# Altium schematic sheet CAN-Sheet.SchDoc
size 420 x 297 mm; SheetNumber: 8; SheetTotal: 15
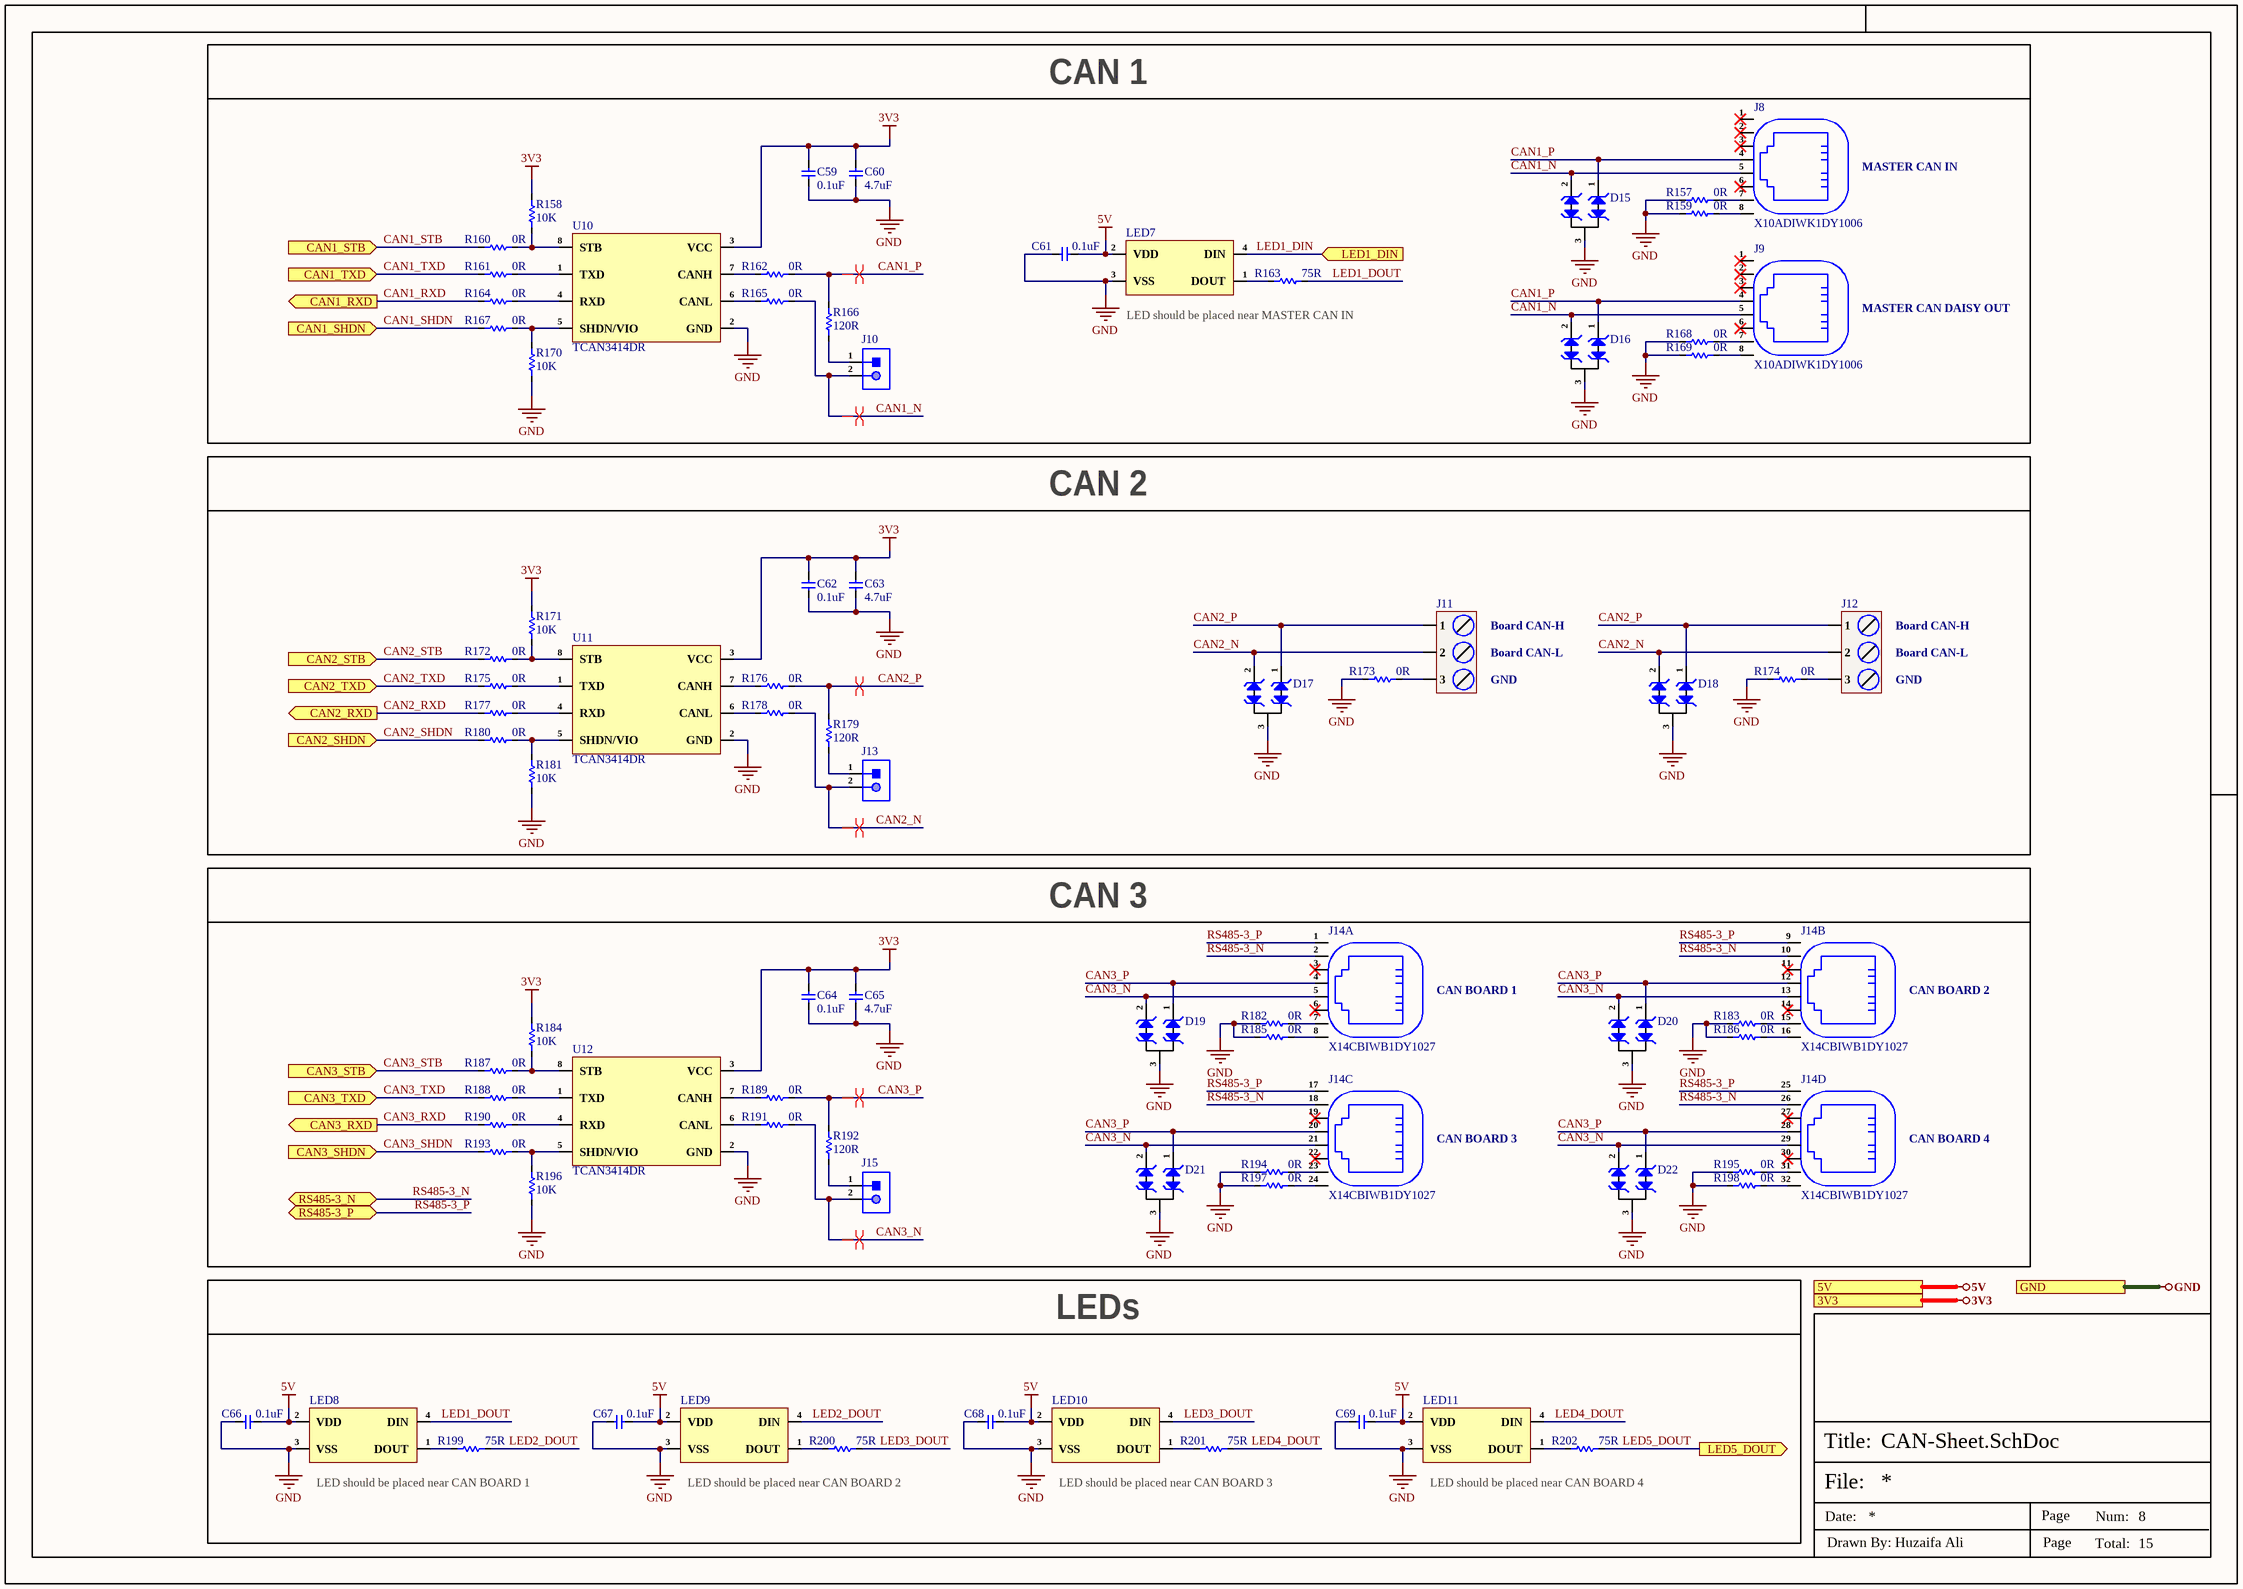
[diagram p0: CAN-Sheet.SchDoc]

## Parts
C59  0.1uF  [Cap-0402]
C60  4.7uF  [Cap-0402]
C61  0.1uF  [Cap-0402]
C62  0.1uF  [Cap-0402]
C63  4.7uF  [Cap-0402]
C64  0.1uF  [Cap-0402]
C65  4.7uF  [Cap-0402]
C66  0.1uF  [Cap-0402]
C67  0.1uF  [Cap-0402]
C68  0.1uF  [Cap-0402]
C69  0.1uF  [Cap-0402]
D15  CDSOT23-T24CAN-Q  [SOT-23]  (value not drawn)
D16  CDSOT23-T24CAN-Q  [SOT-23]  (value not drawn)
D17  CDSOT23-T24CAN-Q  [SOT-23]  (value not drawn)
D18  CDSOT23-T24CAN-Q  [SOT-23]  (value not drawn)
D19  CDSOT23-T24CAN-Q  [SOT-23]  (value not drawn)
D20  CDSOT23-T24CAN-Q  [SOT-23]  (value not drawn)
D21  CDSOT23-T24CAN-Q  [SOT-23]  (value not drawn)
D22  CDSOT23-T24CAN-Q  [SOT-23]  (value not drawn)
J8  X10ADIWK1DY1006  [X10ADIWK1DY1006]
J9  X10ADIWK1DY1006  [X10ADIWK1DY1006]
J10  X6511WV-02H-C60D30  [HDR1X2_]  (value not drawn)
J11  DB128L-5.08-3P-BK-S  [DB128L-5.08-3P-BK-S]  (value not drawn)
J12  DB128L-5.08-3P-BK-S  [DB128L-5.08-3P-BK-S]  (value not drawn)
J13  X6511WV-02H-C60D30  [HDR1X2_]  (value not drawn)
J14  X14CBIWB1DY1027  [X14CBIWB1DY1027]  (parts A,B,C,D of 4)
J15  X6511WV-02H-C60D30  [HDR1X2_]  (value not drawn)
LED7  WS2812D-F5  [WS2812D-F5]  (value not drawn)
LED8  WS2812D-F5  [WS2812D-F5]  (value not drawn)
LED9  WS2812D-F5  [WS2812D-F5]  (value not drawn)
LED10  WS2812D-F5  [WS2812D-F5]  (value not drawn)
LED11  WS2812D-F5  [WS2812D-F5]  (value not drawn)
R157  0R  [Res-0402]
R158  10K  [Res-0402]
R159  0R  [Res-0402]
R160  0R  [Res-0402]
R161  0R  [Res-0402]
R162  0R  [Res-0402]
R163  75R  [Res-0402]
R164  0R  [Res-0402]
R165  0R  [Res-0402]
R166  120R  [Res-0603]
R167  0R  [Res-0402]
R168  0R  [Res-0402]
R169  0R  [Res-0402]
R170  10K  [Res-0402]
R171  10K  [Res-0402]
R172  0R  [Res-0402]
R173  0R  [Res-0402]
R174  0R  [Res-0402]
R175  0R  [Res-0402]
R176  0R  [Res-0402]
R177  0R  [Res-0402]
R178  0R  [Res-0402]
R179  120R  [Res-0603]
R180  0R  [Res-0402]
R181  10K  [Res-0402]
R182  0R  [Res-0402]
R183  0R  [Res-0402]
R184  10K  [Res-0402]
R185  0R  [Res-0402]
R186  0R  [Res-0402]
R187  0R  [Res-0402]
R188  0R  [Res-0402]
R189  0R  [Res-0402]
R190  0R  [Res-0402]
R191  0R  [Res-0402]
R192  120R  [Res-0603]
R193  0R  [Res-0402]
R194  0R  [Res-0402]
R195  0R  [Res-0402]
R196  10K  [Res-0402]
R197  0R  [Res-0402]
R198  0R  [Res-0402]
R199  75R  [Res-0402]
R200  75R  [Res-0402]
R201  75R  [Res-0402]
R202  75R  [Res-0402]
U10  TCAN3414DR  [SOIC-8(0.154", 3.90mm Width)]
U11  TCAN3414DR  [SOIC-8(0.154", 3.90mm Width)]
U12  TCAN3414DR  [SOIC-8(0.154", 3.90mm Width)]

## Blocks framed on the sheet
CAN 1: C59-C61 D15 D16 J8-J10 LED7 R157-R170 U10
CAN 2: C62 C63 D17 D18 J11-J13 R171-R181 U11
CAN 3: C64 C65 D19-D22 J14 J15 R182-R198 U12
LEDs: C66-C69 LED8-LED11 R199-R202

## Ports
3V3 (see Top-Sheet[2B], Buttons-Lights-Sensors-Sheet[4D], Controller-Sheet-1[4D], Controller-Sheet-2[4D], EtherCAT-Sheet[1D], Ethernet-PHY-Sheet[4D], Power-Sheet[4D], RS232-Sheet[5D], RS485-Sheet[5D], USB-Sheet[4D], VFD-Support-Sheet[4D]), 5V (see Top-Sheet[2B], Buttons-Lights-Sensors-Sheet[4D], Controller-Sheet-2[4D], Power-Sheet[4D], RS232-Sheet[5D], RS485-Sheet[5D], USB-Sheet[4D], VFD-Support-Sheet[4D]), CAN1_RXD (out, see Top-Sheet[2C]), CAN1_SHDN (in, see Top-Sheet[2B]), CAN1_STB (in, see Top-Sheet[2B]), CAN1_TXD (in, see Top-Sheet[2B]), CAN2_RXD (out, see Top-Sheet[2C]), CAN2_SHDN (in, see Top-Sheet[2C]), CAN2_STB (in, see Top-Sheet[2C]), CAN2_TXD (in, see Top-Sheet[2B]), CAN3_RXD (out, see Top-Sheet[2C]), CAN3_SHDN (in, see Top-Sheet[2C]), CAN3_STB (in, see Top-Sheet[2C]), CAN3_TXD (in, see Top-Sheet[2C]), GND (see Top-Sheet[2B], Buttons-Lights-Sensors-Sheet[4D], Controller-Sheet-1[4D], Controller-Sheet-2[4D], Controller-Sheet-3[4D], EtherCAT-Sheet[1D], Ethernet-PHY-Sheet[4D], Extra-DIOs[4D], Power-Sheet[4D], RS232-Sheet[5D], RS485-Sheet[5D], USB-Sheet[4D], VFD-Support-Sheet2[4D], VFD-Support-Sheet[4D]), LED1_DIN (in, see Top-Sheet[2C]), LED5_DOUT (out, see Top-Sheet[2C], RS232-Sheet[5B]), RS485-3_N (bidir, see Top-Sheet[2C], RS485-Sheet[3D]), RS485-3_P (bidir, see Top-Sheet[2C], RS485-Sheet[3D])

## Nets
3V3: C59.2 C60.2 C62.2 C63.2 C64.2 C65.2 R158.2 R171.2 R184.2 U10.3(VCC) U11.3(VCC) U12.3(VCC) ; port 3V3
5V: C61.2 C66.2 C67.2 C68.2 C69.2 LED7.2(VDD) LED8.2(VDD) LED9.2(VDD) LED10.2(VDD) LED11.2(VDD) ; port 5V
GND: C59.1 C60.1 C61.1 C62.1 C63.1 C64.1 C65.1 C66.1 C67.1 C68.1 C69.1 D15.3 D16.3 D17.3 D18.3 D19.3 D20.3 D21.3 D22.3 LED7.3(VSS) LED8.3(VSS) LED9.3(VSS) LED10.3(VSS) LED11.3(VSS) R157.1 R159.1 R168.1 R169.1 R170.1 R173.1 R174.1 R181.1 R182.1 R183.1 R185.1 R186.1 R194.1 R195.1 R196.1 R197.1 R198.1 U10.2(GND) U11.2(GND) U12.2(GND) ; port GND
CAN1_N: D15.2 D16.2 J8.5 J9.5 J10.2 R165.2
CAN1_P: D15.1 D16.1 J8.4 J9.4 R162.2 R166.2
CAN1_RXD: R164.1 ; port CAN1_RXD
CAN1_SHDN: R167.1 ; port CAN1_SHDN
CAN1_STB: R160.1 ; port CAN1_STB
CAN1_TXD: R161.1 ; port CAN1_TXD
CAN2_N: D17.2 D18.2 J11.2 J12.2 J13.2 R178.2
CAN2_P: D17.1 D18.1 J11.1 J12.1 R176.2 R179.2
CAN2_RXD: R177.1 ; port CAN2_RXD
CAN2_SHDN: R180.1 ; port CAN2_SHDN
CAN2_STB: R172.1 ; port CAN2_STB
CAN2_TXD: R175.1 ; port CAN2_TXD
CAN3_N: D19.2 D20.2 D21.2 D22.2 J14.5 J14.13 J14.21 J14.29 J15.2 R191.2
CAN3_P: D19.1 D20.1 D21.1 D22.1 J14.4 J14.12 J14.20 J14.28 R189.2 R192.2
CAN3_RXD: R190.1 ; port CAN3_RXD
CAN3_SHDN: R193.1 ; port CAN3_SHDN
CAN3_STB: R187.1 ; port CAN3_STB
CAN3_TXD: R188.1 ; port CAN3_TXD
LED1_DIN: LED7.4(DIN) ; port LED1_DIN
LED1_DOUT: LED8.4(DIN) R163.2
LED2_DOUT: LED9.4(DIN) R199.2
LED3_DOUT: LED10.4(DIN) R200.2
LED4_DOUT: LED11.4(DIN) R201.2
LED5_DOUT: R202.2 ; port LED5_DOUT
RS485-3_N: J14.2 J14.10 J14.18 J14.26 ; port RS485-3_N
RS485-3_P: J14.1 J14.9 J14.17 J14.25 ; port RS485-3_P
NetJ8_7: J8.7 R157.2
NetJ8_8: J8.8 R159.2
NetJ9_7: J9.7 R168.2
NetJ9_8: J9.8 R169.2
NetJ10_1: J10.1 R166.1
NetJ11_3: J11.3 R173.2
NetJ12_3: J12.3 R174.2
NetJ13_1: J13.1 R179.1
NetJ14_7: J14.7 R182.2
NetJ14_8: J14.8 R185.2
NetJ14_15: J14.15 R183.2
NetJ14_16: J14.16 R186.2
NetJ14_23: J14.23 R194.2
NetJ14_24: J14.24 R197.2
NetJ14_31: J14.31 R195.2
NetJ14_32: J14.32 R198.2
NetJ15_1: J15.1 R192.1
NetLED7_1: LED7.1(DOUT) R163.1
NetLED8_1: LED8.1(DOUT) R199.1
NetLED9_1: LED9.1(DOUT) R200.1
NetLED10_1: LED10.1(DOUT) R201.1
NetLED11_1: LED11.1(DOUT) R202.1
NetR158_1: R158.1 R160.2 U10.8(STB)
NetR161_2: R161.2 U10.1(TXD)
NetR162_1: R162.1 U10.7(CANH)
NetR164_2: R164.2 U10.4(RXD)
NetR165_1: R165.1 U10.6(CANL)
NetR167_2: R167.2 R170.2 U10.5(SHDN/VIO)
NetR171_1: R171.1 R172.2 U11.8(STB)
NetR175_2: R175.2 U11.1(TXD)
NetR176_1: R176.1 U11.7(CANH)
NetR177_2: R177.2 U11.4(RXD)
NetR178_1: R178.1 U11.6(CANL)
NetR180_2: R180.2 R181.2 U11.5(SHDN/VIO)
NetR184_1: R184.1 R187.2 U12.8(STB)
NetR188_2: R188.2 U12.1(TXD)
NetR189_1: R189.1 U12.7(CANH)
NetR190_2: R190.2 U12.4(RXD)
NetR191_1: R191.1 U12.6(CANL)
NetR193_2: R193.2 R196.2 U12.5(SHDN/VIO)

Not connected (* = marked no-connect by the designer): J8 1* 2* 3* 6*; J9 1* 2* 3* 6*; J14 3* 6* 11* 14* 19* 22* 27* 30*

## Layout directives
differential pair; differential pair class CAN: CAN1_N, CAN1_P, CAN2_N, CAN2_P, CAN3_N, CAN3_P

## Notes on the sheet
- MASTER CAN IN
- LED should be placed near MASTER CAN IN
- MASTER CAN DAISY OUT
- Board CAN-H
- Board CAN-L
- GND
- CAN BOARD 1
- CAN BOARD 2
- CAN BOARD 3
- CAN BOARD 4
- LED should be placed near CAN BOARD 1
- LED should be placed near CAN BOARD 2
- LED should be placed near CAN BOARD 3
- LED should be placed near CAN BOARD 4
- File:
- Title:
- Date:
- Page
- Num:
- Total:
- Drawn By: Huzaifa Ali

## Library data of the parts
C59 C61 C62 C64 C66-C69 = CC0402JRX7R7BB104: CAP CER 0.1UF 16V X7R 0402; Manufacturer: Yageo; Material: 4241ConductorMaterial; Value: 100nF; Tolerance: 5%; Item Type: Capacitor; Supplier: Digikey; Supplier Part Number: 311-1676-1-ND; Manufacturer Part Number: CC0402JRX7R7BB104; RoHS: Yes; Category: Ceramic Capacitors; Stock: 1659111; Pricing: 1=0.1, 10=0.046, 50=0.0262, 100=0.0203, 500=0.01528, 1000=0.012, 2500=0.01091, 5000=0.01004 (USD); Mounting Technology: Surface Mount; Case/Package: 0402; Case Code (Metric): 1005; Case Code (Imperial): 0402; Min Operating Temperature: -55°C; Max Operating Temperature: 125°C; Dielectric: X7R; Packaging: Tape and Reel; Package Quantity: 10000; Voltage Rating (DC): 16V; Voltage Rating: 16V; Series: CC; Construction: Flat; Length: 0.039inch; Width: 0.02inch; Height: 0.5mm; Thickness: 0.022inch; Lead Free: Lead Free; Halogen Free: Halogen Free; RoHS Compliant: Yes; ComponentLink1URL: https://datasheet.ciiva.com/13210/upy-gphc-x7r-6-3v-to-50v-8-12304-13210152.pdf?src-supplier=Mouser; ComponentLink1Description: https://datasheet.ciiva.com/13210/upy-gphc-x7r-6-3v-to-50v-8-12304-13210152.pdf?src-supplier=Mouser; LCSC Part Number: C541464
C60 C63 C65 = CC0402KRX5R6BB475: CAP CER 4.7UF 10V X5R 0402; Manufacturer: Yageo; Tolerance: 10%; Supplier 1: Farnell; Manufacturer Part Number: CC0402KRX5R6BB475; RoHS: Yes; Category: Ceramic Capacitors; Stock 1: 20000; Pricing 1: 10000=0.02310, 50000=0.02100 (GBP); Mount: Surface Mount; Case/Package: 0402; Case Code (Imperial): 0402; Case Code (Metric): 1005; Min Operating Temperature: -55°C; Max Operating Temperature: 85°C; Packaging: Cut Tape; Capacitance: 4.7uF; Voltage Rating: 10V; RoHS Compliant: Yes; ComponentLink1URL: http://www.yageo.com/documents/recent/UPY-GPHC_X5R_4V-to-50V_25.pdf?src-supplier=Digi-Key; ComponentLink1Description: http://www.yageo.com/documents/recent/UPY-GPHC_X5R_4V-to-50V_25.pdf?src-supplier=Digi-Key; Supplier Part Number 1: 3871698; LCSC Part Number: C326586
D15-D22 = CDSOT23-T24CAN-Q: TVS DIODE 24VWM 40VC SOT23-3; Manufacturer: Bourns; Item Type: TVS Diodes; Supplier: Digikey; LCSC Part Number: C350941; Manufacturer Part Number: CDSOT23-T24CAN-Q; RoHS: Yes; Stock: 17231; Pricing: 1=0.36, 10=0.282, 100=0.1691, 500=0.15656, 1000=0.10645, 3000=0.098, 6000=0.09393, 9000=0.08454, 30000=0.08328, 75000=0.07827 (USD); RoHS Compliant: 5897YesNo; ComponentLink1URL: http://www.farnell.com/datasheets/2372435.pdf?src-supplier=Farnell; ComponentLink1Description: http://www.farnell.com/datasheets/2372435.pdf?src-supplier=Farnell; ComponentLink2URL: https://www.bourns.com/docs/Product-Datasheets/cdsot23-t24can-Q.pdf?src-supplier=Digikey; ComponentLink2Description: https://www.bourns.com/docs/Product-Datasheets/cdsot23-t24can-Q.pdf?src-supplier=Digikey; ComponentLink3URL: http://www.farnell.com/datasheets/2372435.pdf?src-supplier=Newark; ComponentLink3Description: http://www.farnell.com/datasheets/2372435.pdf?src-supplier=Newark
J8 J9 = X10ADIWK1DY1006: RJ45Receptacle Unshielded 1 Bend-in Gold Phosphor Bronze Without LED -40℃~+85℃ Plugin Ethernet Connectors / Modular Connectors (RJ45 RJ11) ROHS; Manufacturer: XKB Connection; Manufacturer Part Number: X10ADIWK1DY1006; Package: Plugin; LCSC Part Number: C2916456; Item Type: Connectors (RJ45 RJ11); ComponentLink1Description: LCSC; ComponentLink1URL: https://www.lcsc.com/product-detail/Ethernet-Connectors-Modular-Connectors-RJ45-RJ11_XKB-Connection-X10ADIWK1DY1006_C2916456.html
J10 J13 J15 = X6511WV-02H-C60D30: Gold 250V 3A Straight Square Pins 2.5mm 2P 260℃ 6mm -40℃~+105℃ 3mm 2.54mm Plugin Black Brass 1x2P Plugin,P=2.54mm Pin Headers ROHS; Manufacturer: XKB; Item Type: Male Header; Manufacturer Part Number: X6511WV-02H-C60D30; Package: Plugin,P=2.54mm; LCSC Part Number: C706874; ComponentLink1Description: LCSC; ComponentLink1URL: https://www.lcsc.com/product-detail/Pin-Headers_XKB-Connectivity-X6511WV-02H-C60D30_C706874.html
J11 J12 = DB128L-5.08-3P-BK-S: 1x3P 18A -40℃~+105℃ 250V Black 12~30 Straight pin 5.08mm 2.5 1 3 Plugin,P=5.08mm Screw terminal ROHS; Manufacturer: DIBO; Item Type: Terminal Block; Manufacturer Part Number: DB128L-5.08-3P-BK-S; Package: Plugin,P=5.08mm; LCSC Part Number: C430602; ComponentLink1Description: LCSC; ComponentLink1URL: https://www.lcsc.com/product-detail/Screw-terminal_DIBO-DB128L-5-08-3P-BK-S_C430602.html
J14 = X14CBIWB1DY1027: RJ45Receptacle 4 Unshielded Bend-in Gold Phosphor Bronze Without LED -40℃~+85℃ Plugin Ethernet Connectors / Modular Connectors (RJ45 RJ11) ROHS; Manufacturer: XKB Connection; Manufacturer Part Number: X14CBIWB1DY1027; Package: Plugin; LCSC Part Number: C2931489; Item Type: Connectors (RJ45 RJ11); ComponentLink1Description: LCSC; ComponentLink1URL: https://www.lcsc.com/product-detail/Ethernet-Connectors-Modular-Connectors-RJ45-RJ11_XKB-Connection-X14CBIWB1DY1027_C2931489.html
LED7-LED11 = WS2812D-F5: Plugin,D=5mm RGB LEDs ROHS; Manufacturer: Worldsemi; Item Type: RGB LED; Manufacturer Part Number: WS2812D-F5; Package: Plugin,D=5mm; LCSC Part Number: C190565; ComponentLink1Description: LCSC; ComponentLink1URL: https://jlcpcb.com/partdetail/Worldsemi-WS2812DF5/C190565
R157 R159-R162 R164 R165 R167-R169 R172-R178 R180 R182 R183 R185-R191 R193-R195 R197 R198 = RC0402FR-070RL: RES 0 OHM JUMPER 1/16W 0402; Manufacturer: Yageo; Item Type: Resistors; Tolerance: 1%; Power Rating: 62.5mW; Voltage Rating: 50V; Temperature Coefficient: 200ppm/°C; Max Power Dissipation: 63mW; Supplier 1: Mouser; Manufacturer Part Number: RC0402FR-070RL; RoHS: Yes; Stock 1: 8556842; Pricing 1: 1=0.10000, 10=0.01400, 50=0.01400, 100=0.00600, 1000=0.00300, 5000=0.00200, 10000=0.00100 (USD); Mount: Surface Mount; Case/Package: 0402; Contact Plating: Tin,Matte; Case Code (Imperial): 0402; Case Code (Metric): 1005; Size Code: 0402; Min Operating Temperature: -55°C; Max Operating Temperature: 155°C; Resistance: 0R; Resistor Type: Thick Film; Packaging: Tape and Reel; Termination: SMD/SMT; Features: Moisture Resistant; Series: RC; Number of Terminations: 2; Length: 1mm; Width: 0.5mm; Height: 0.35mm; Radiation Hardening: No; Lead Free: Lead Free; RoHS Compliant: Yes; ComponentLink1URL: https://datasheet.ciiva.com/8896/pyu-rc0402-51-rohs-l-6-8896149.pdf?src-supplier=Avnet; ComponentLink1Description: https://datasheet.ciiva.com/8896/pyu-rc0402-51-rohs-l-6-8896149.pdf?src-supplier=Avnet; ComponentLink2URL: https://datasheet.ciiva.com/16790/pyu-rc0402-51-rohs-l-6-r-16790444.pdf?src-supplier=Future+Electronics; ComponentLink2Description: https://datasheet.ciiva.com/16790/pyu-rc0402-51-rohs-l-6-r-16790444.pdf?src-supplier=Future+Electronics; Supplier Part Number 1: 603-RC0402FR-070RL; LCSC Part Number: C106231
R158 R170 R171 R181 R184 R196 = RC0402FR-0710KL: RES 10K OHM 1% 1/16W 0402; Manufacturer: Yageo; Resistance: 10kR; Voltage Rating (DC): 50V; Temperature Coefficient: 100ppm/°C; Power Rating: 62.5mW; Max Power Dissipation: 63mW; Item Type: Resistor; Supplier 1: Mouser; Manufacturer Part Number: RC0402FR-0710KL; RoHS: Yes; Category: Chip SMD Resistors; Stock 1: 18648329; Pricing 1: 1=0.10000, 10=0.01400, 50=0.01400, 100=0.00500, 1000=0.00300, 10000=0.00200 (USD); Case/Package: 0402; Number of Pins: 2; Case Code (Imperial): 0402; Case Code (Metric): 1005; Min Operating Temperature: -55°C; Max Operating Temperature: 155°C; Resistor Type: Thick Film; Tolerance: 1%; Packaging: Tape and Reel; Voltage Rating: 50V; Termination: SMD/SMT; Working Voltage: 50V; Number of Terminations: 2; Features: Moisture Resistant; Series: RC; Resistance Tolerance: 1%; Construction: Rectangular; Length: 1mm; Width: 0.5mm; Height: 0.32mm; Depth: 0.5mm; Lead Pitch: 0.2mm; REACH SVHC: No SVHC; Lead Free: Lead Free; RoHS Compliant: Yes; Military Standard: Not; ComponentLink1URL: https://datasheet.ciiva.com/7660/38568-7660787.pdf?src-supplier=Element14; ComponentLink1Description: https://datasheet.ciiva.com/7660/38568-7660787.pdf?src-supplier=Element14; ComponentLink2URL: https://datasheet.ciiva.com/7849/1686128-7849814.pdf?src-supplier=Element14; ComponentLink2Description: https://datasheet.ciiva.com/7849/1686128-7849814.pdf?src-supplier=Element14; ComponentLink3URL: https://datasheet.ciiva.com/7983/1018594-7983486.pdf?src-supplier=Element14; ComponentLink3Description: https://datasheet.ciiva.com/7983/1018594-7983486.pdf?src-supplier=Element14; ComponentLink4URL: https://datasheet.ciiva.com/22747/1018594-22747512.pdf?src-supplier=Element14; ComponentLink4Description: https://datasheet.ciiva.com/22747/1018594-22747512.pdf?src-supplier=Element14; ComponentLink5URL: https://datasheet.ciiva.com/12667/pyu-rc0402-51-rohs-l-6-r-12667067.pdf?src-supplier=Mouser; ComponentLink5Description: https://datasheet.ciiva.com/12667/pyu-rc0402-51-rohs-l-6-r-12667067.pdf?src-supplier=Mouser; ComponentLink6URL: https://datasheet.ciiva.com/7849/1784430-7849813.pdf?src-supplier=Element14; ComponentLink6Description: https://datasheet.ciiva.com/7849/1784430-7849813.pdf?src-supplier=Element14; ComponentLink7URL: https://datasheet.ciiva.com/7849/1784430-7849815.pdf?src-supplier=Element14; ComponentLink7Description: https://datasheet.ciiva.com/7849/1784430-7849815.pdf?src-supplier=Element14; Supplier Part Number 1: 603-RC0402FR-0710KL; LCSC Part Number: C60490
R163 R199-R202 = RC0402JR-0775RL: RES 75 OHM 5% 1/16W 0402; Manufacturer: Yageo; Item Type: Resistor; Temperature Coefficient: 100ppm/°C; Power Rating: 62.5mW; Voltage Rating: 50V; Max Power Dissipation: 63mW; Supplier: Digikey; Supplier Part Number: 311-75JRCT-ND; Manufacturer Part Number: RC0402JR-0775RL; RoHS: Yes; Stock: 2993323; Pricing: 1=0.1, 10=0.018, 50=0.0102, 100=0.0083, 500=0.00528, 1000=0.00444, 5000=0.00307 (USD); Case/Package: 0402; Pins: 2; Contact Plating: Tin,Lead; Case Code (Imperial): 0402; Case Code (Metric): 1005; Min Operating Temperature: -55°C; Max Operating Temperature: 155°C; Value: 75R; Tolerance: 5%; Resistor Type: Thick Film; Packaging: Tape and Reel; Termination: SMD/SMT; Voltage Rating (DC): 50V; Features: Moisture Resistant; Series: RC; Number of Terminations: 2; Resistance Tolerance: 5%; Length: 1mm; Width: 0.5mm; Height: 0.35mm; Reach SVHC Compliant: No; Lead Free: Lead Free; RoHS Compliant: Yes; ComponentLink1URL: https://datasheet.ciiva.com/7983/1018594-7983612.pdf?src-supplier=Element14; ComponentLink1Description: https://datasheet.ciiva.com/7983/1018594-7983612.pdf?src-supplier=Element14; ComponentLink2URL: https://datasheet.ciiva.com/17082/pyu-rc0402-51-rohs-l-6-r-17082239.pdf?src-supplier=Future+Electronics; ComponentLink2Description: https://datasheet.ciiva.com/17082/pyu-rc0402-51-rohs-l-6-r-17082239.pdf?src-supplier=Future+Electronics; LCSC Part Number: C137841
R166 R179 R192 = RC0603FR-07120RL: RES 120 OHM 1% 1/10W 0603; Manufacturer: Yageo; Temperature Coefficient: 100ppm/°C; Voltage Rating (DC): 50V; Power Rating: 100mW; Item Type: Resistor; Supplier 1: Digi-Key; Manufacturer Part Number: RC0603FR-07120RL; RoHS: Yes; Category: Chip SMD Resistors; Stock 1: 839061; Pricing 1: 1=0.10000, 10=0.02400, 100=0.00970, 1000=0.00436, 2500=0.00378 (USD); Case/Package: 0603; Number of Pins: 2; Case Code (Metric): 1608; Case Code (Imperial): 0603; Size Code: 0603; Min Operating Temperature: -55°C; Max Operating Temperature: 155°C; Resistance: 120R; Tolerance: 1%; Resistor Type: Thick Film; Packaging: Tape and Reel; Voltage Rating: 50V; Package Quantity: 1; Number of Terminations: 2; Termination: SMD/SMT; Max Power Dissipation: 100mW; Features: Moisture Resistant; Series: RC; Construction: Rectangular; Resistance Tolerance: 1%; Length: 1.6mm; Width: 0.031inch; Height: 0.022inch; Depth: 0.8mm; REACH SVHC: No SVHC; Lead Free: Lead Free; Military Standard: Not; RoHS Compliant: Yes; ComponentLink1URL: https://datasheet.ciiva.com/2553/pyu-r-int-thick-7-2553512.pdf?src-supplier=Digi-Key; ComponentLink1Description: https://datasheet.ciiva.com/2553/pyu-r-int-thick-7-2553512.pdf?src-supplier=Digi-Key; ComponentLink2URL: https://datasheet.ciiva.com/7746/443971-7746248.pdf?src-supplier=Element14; ComponentLink2Description: https://datasheet.ciiva.com/7746/443971-7746248.pdf?src-supplier=Element14; ComponentLink3URL: https://datasheet.ciiva.com/2553/pyu-r-int-thick-7-2553513.pdf?src-supplier=Digi-Key; ComponentLink3Description: https://datasheet.ciiva.com/2553/pyu-r-int-thick-7-2553513.pdf?src-supplier=Digi-Key; ComponentLink4URL: https://datasheet.ciiva.com/7746/443971-7746249.pdf?src-supplier=Element14; ComponentLink4Description: https://datasheet.ciiva.com/7746/443971-7746249.pdf?src-supplier=Element14; ComponentLink5URL: https://datasheet.ciiva.com/2553/pyu-r-int-thick-7-2553514.pdf?src-supplier=Digi-Key; ComponentLink5Description: https://datasheet.ciiva.com/2553/pyu-r-int-thick-7-2553514.pdf?src-supplier=Digi-Key; ComponentLink6URL: https://datasheet.ciiva.com/46395/443971-46395021.pdf?src-supplier=Element14; ComponentLink6Description: https://datasheet.ciiva.com/46395/443971-46395021.pdf?src-supplier=Element14; Supplier Part Number 1: 311-120HRCT-ND; LCSC Part Number: C114640
U10-U12 = TCAN3414DR: IC TRANSCEIVER HALF 1/1 8SOIC; Manufacturer: Texas Instruments; Supplier: Mouser; LCSC Part Number: C22396693; Manufacturer Part Number: TCAN3414DR; RoHS: No; Item Type: IC; Stock: 201; Pricing: 1=1.55, 10=1.1, 50=1.1, 100=0.895, 1000=0.763, 10000=0.681 (USD); Case/Package: SOIC; Pins: 8; Length: 4.9mm; Width: 3.91mm; Height: 1.75mm; Thickness: 1.58mm